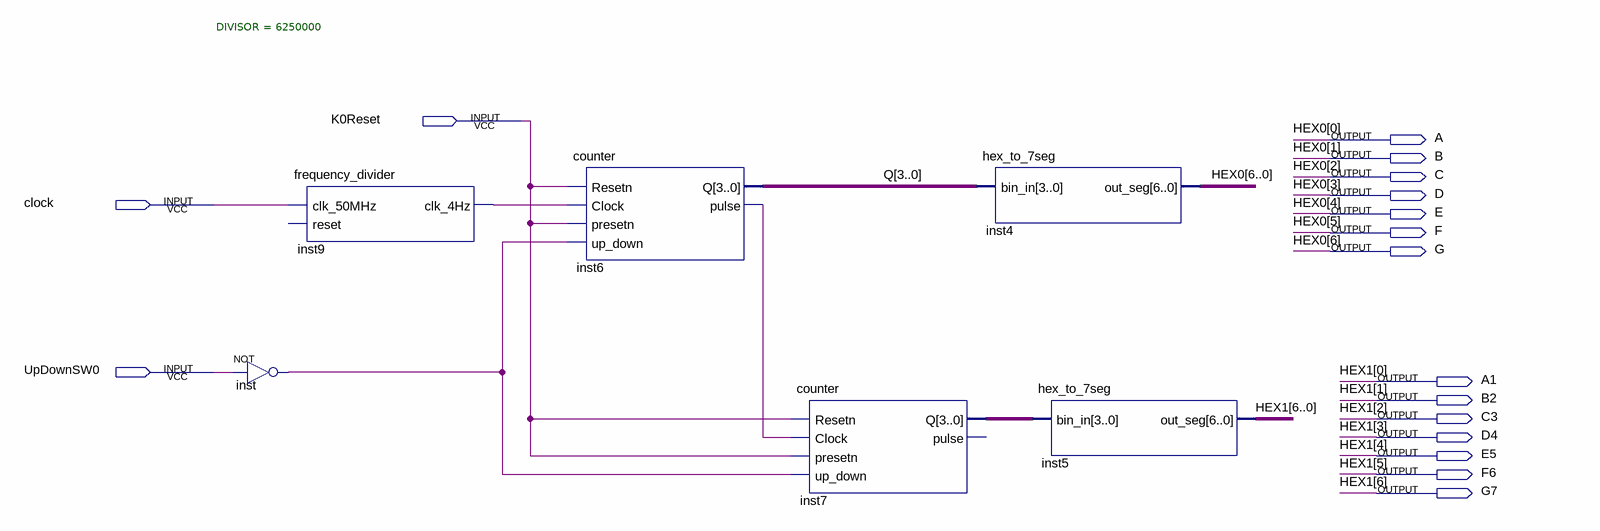
[diagram p0: schematic sheet]
// Quartus schematic Final_Project_John_Nguyen.bdf as structural Verilog: 6 symbols, 17 pins
module Final_Project_John_Nguyen (
  input  K0Reset,
  input  clock,
  input  UpDownSW0,
  output A,
  output B,
  output C,
  output D,
  output E,
  output F,
  output G,
  output A1,
  output B2,
  output C3,
  output D4,
  output E5,
  output F6,
  output G7
);

  wire inst6_pulse, inst9_clk_4hz, inst_out;
  wire [3:0] inst7_q, Q;

  not inst (inst_out, UpDownSW0);
  frequency_divider #(.DIVISOR(6250000)) inst9 (.clk_50MHz(clock), .clk_4Hz(inst9_clk_4hz));  // open: reset
  counter inst6 (
    .Resetn(K0Reset), .Clock(inst9_clk_4hz), .presetn(K0Reset), .up_down(inst_out), .Q(Q), .pulse(inst6_pulse));
  counter inst7 (
    .Resetn(K0Reset), .Clock(inst6_pulse), .presetn(K0Reset), .up_down(inst_out), .Q(inst7_q));  // open: pulse
  hex_to_7seg inst4 (.bin_in(Q), .out_seg({G, F, E, D, C, B, A}));
  hex_to_7seg inst5 (.bin_in(inst7_q), .out_seg({G7, F6, E5, D4, C3, B2, A1}));

  // Other names for the same wires on the sheet: HEX0[6:0] = {G, F, E, D, C, B, A};
  //   HEX1[6:0] = {G7, F6, E5, D4, C3, B2, A1}
endmodule
